# Altium schematic sheet SWITCH_CTRL1.SchDoc
size A4; SheetNumber: 4; SheetTotal: 16
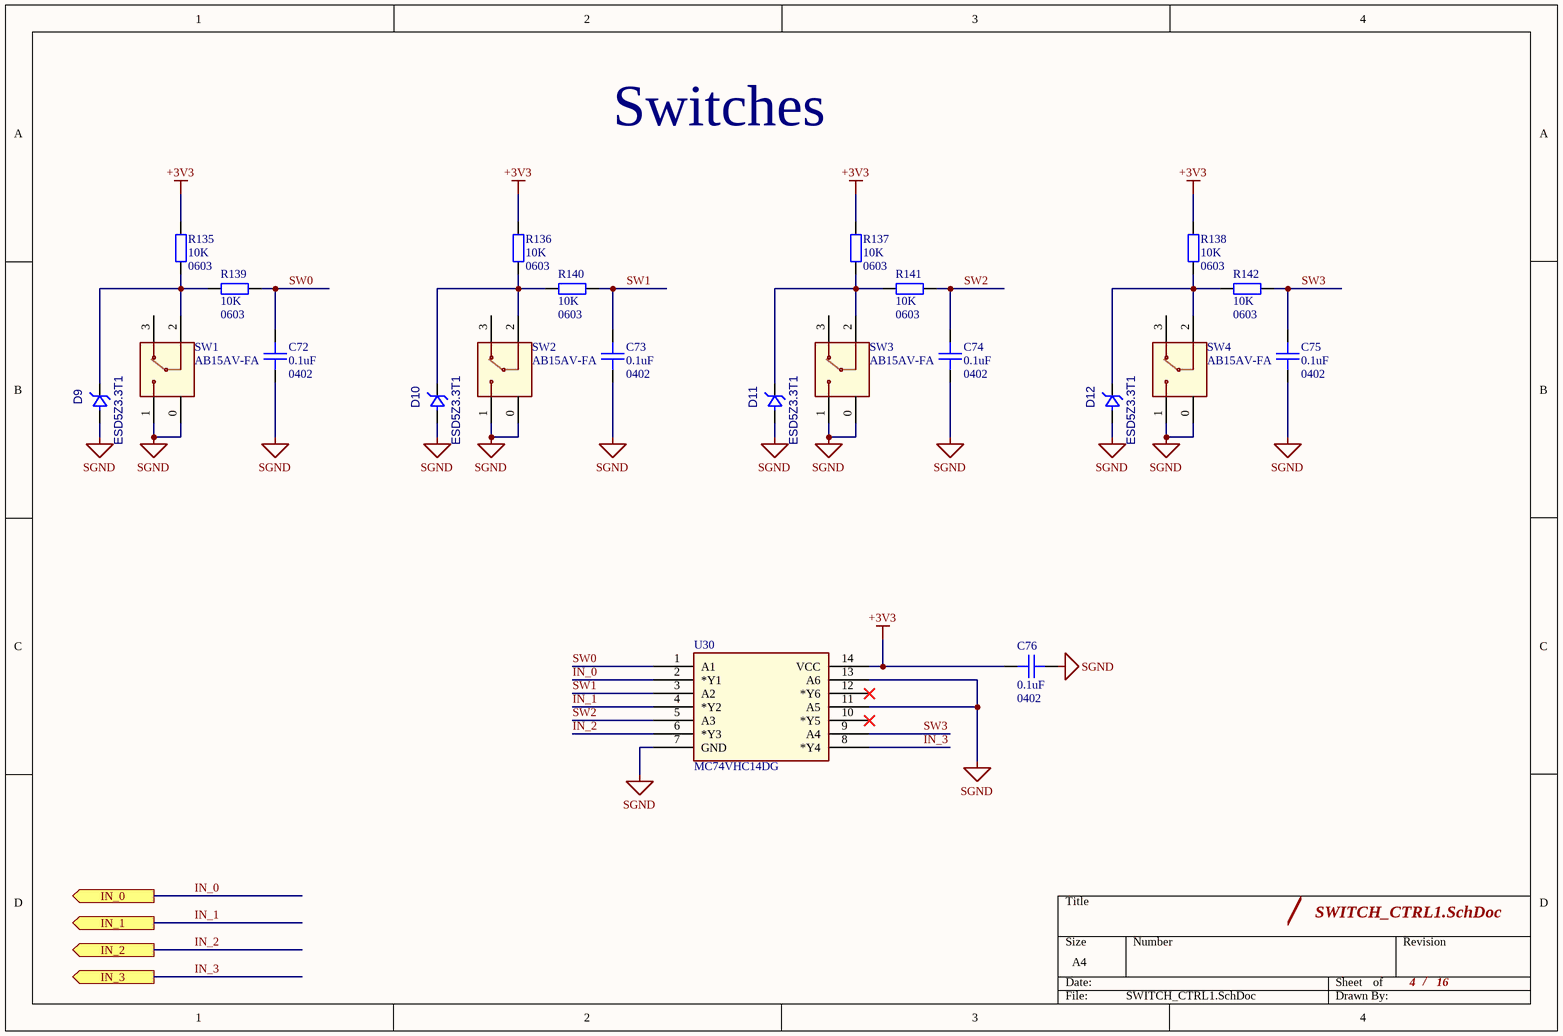
[diagram p0: SWITCH_CTRL1.SchDoc]

## Parts
C72  Capacitance: 0.1uF  Package1: 0402  [CAPC100x50x50L25]  (hidden comment: 04023C104KAT2A)
C73  Capacitance: 0.1uF  Package1: 0402  [CAPC100x50x50L25]  (hidden comment: 04023C104KAT2A)
C74  Capacitance: 0.1uF  Package1: 0402  [CAPC100x50x50L25]  (hidden comment: 04023C104KAT2A)
C75  Capacitance: 0.1uF  Package1: 0402  [CAPC100x50x50L25]  (hidden comment: 04023C104KAT2A)
C76  Capacitance: 0.1uF  Package1: 0402  [CAPC100x50x50L25]  (hidden comment: 04023C104KAT2A)
D9  ESD5Z3.3T1  [SOD-523]
D10  ESD5Z3.3T1  [SOD-523]
D11  ESD5Z3.3T1  [SOD-523]
D12  ESD5Z3.3T1  [SOD-523]
R135  Resistance: 10K  Size2: 0603  [RESC160X80X55L30]  (hidden comment: RC0603FR-0710KL)
R136  Resistance: 10K  Size2: 0603  [RESC160X80X55L30]  (hidden comment: RC0603FR-0710KL)
R137  Resistance: 10K  Size2: 0603  [RESC160X80X55L30]  (hidden comment: RC0603FR-0710KL)
R138  Resistance: 10K  Size2: 0603  [RESC160X80X55L30]  (hidden comment: RC0603FR-0710KL)
R139  Resistance: 10K  Size2: 0603  [RESC160X80X55L30]  (hidden comment: RC0603FR-0710KL)
R140  Resistance: 10K  Size2: 0603  [RESC160X80X55L30]  (hidden comment: RC0603FR-0710KL)
R141  Resistance: 10K  Size2: 0603  [RESC160X80X55L30]  (hidden comment: RC0603FR-0710KL)
R142  Resistance: 10K  Size2: 0603  [RESC160X80X55L30]  (hidden comment: RC0603FR-0710KL)
SW1  AB15AV-FA  [AB15AV-FA]
SW2  AB15AV-FA  [AB15AV-FA]
SW3  AB15AV-FA  [AB15AV-FA]
SW4  AB15AV-FA  [AB15AV-FA]
U30  MC74VHC14DG  [SOIC14P127_865X600X175L83X41]

## Ports
IN_0 (out), IN_1 (out), IN_2 (out), IN_3 (out)

## Nets
+3V3: C76.2 R135.2 R136.2 R137.2 R138.2 U30.14(VCC)
SGND: C72.1 C73.1 C74.1 C75.1 C76.1 D9.2(A) D10.2(A) D11.2(A) D12.2(A) SW1.0(SH) SW1.1 SW2.0(SH) SW2.1 SW3.0(SH) SW3.1 SW4.0(SH) SW4.1 U30.7(GND) U30.11(A5) U30.13(A6)
IN_0: U30.2(*Y1) ; port IN_0
IN_1: U30.4(*Y2) ; port IN_1
IN_2: U30.6(*Y3) ; port IN_2
IN_3: U30.8(*Y4) ; port IN_3
SW0: C72.2 R139.2 U30.1(A1)
SW1: C73.2 R140.2 U30.3(A2)
SW2: C74.2 R141.2 U30.5(A3)
SW3: C75.2 R142.2 U30.9(A4)
NetD9_1: D9.1(K) R135.1 R139.1 SW1.2
NetD10_1: D10.1(K) R136.1 R140.1 SW2.2
NetD11_1: D11.1(K) R137.1 R141.1 SW3.2
NetD12_1: D12.1(K) R138.1 R142.1 SW4.2

Not connected (* = marked no-connect by the designer): SW1 3; SW2 3; SW3 3; SW4 3; U30 10(*Y5)* 12(*Y6)*

## Notes on the sheet
- Switches
- /

## Library data of the parts
C72-C76 = CMP-001-0374-4: 0402 25V X7R 100 NF 10%; Manufacturer: KYOCERA AVX; Op Temp max: 85°C; Op Temp min: -55°C; ComponentLink3URL: https://www.digikey.com/en/products/detail/yageo/CC0402MRX5R5BB106/5195138; MPN: 04023C104KAT2A; ComponentLink1URL: https://www.yageo.com/upload/media/product/productsearch/datasheet/mlcc/UPY-GPHC_X5R_4V-to-50V_26.pdf; Package: 0402 (1005 Metric); Size: 1.00mm x 0.50mm; Height max: 700µm; Mounting Type: SM; Tolerance: 10%; ComponentLink1Description: Datasheet; ComponentLink3Description: Digikey; Ratings: -; Dielectric: X7R; ComponentLink2Description: Mouser; ComponentLink2URL: https://eu.mouser.com/ProductDetail/YAGEO/CC0402MRX5R5BB106?qs=zEY9bCHj09eCmUJdZuS5Lg%3D%3D; Lead Spacing: 0mm; Component Type: Ceramic Capacitor; Voltage Rating: 25V
D9-D12 = ESD5Z3.3T1: TVS DIODE 3.3VWM 14.1VC SOD523; MPN: ESD5Z3.3T1G/T5G; Type: Zener; Voltage - Reverse Standoff (Typ): 3.3V (Max); Voltage - Breakdown (Min): 5V; Voltage - Clamping (Max) @ Ipp: 14.1V; Capacitance @ Frequency: 105pF @ 1MHz; Temperature MIN: -55°C; Temperature MAX: 150°C; Package: SC-79, SOD-523; ComponentLink1Description: Datasheet; ComponentLink1URL: https://www.onsemi.com/pdf/datasheet/esd5z2.5t1-d.pdf; ComponentLink2Description: DigiKey; ComponentLink2URL: https://www.digikey.com/en/products/detail/onsemi/esd5z3-3t1/1476606
R135-R142 = CMP-001-0628-7: RES 10K OHM 1% 1/10W 0603; Manufacturer: YAGEO; Power: 100mW; Temperature Coefficient: ±100ppm; Op Temp max: 155°C; Op Temp min: -55°C; PMNT: DNP; Ratings: -; ComponentLink3URL: https://www.digikey.com/en/products/detail/yageo/RC0603FR-0710KL/726880?s=N4IgTCBcDaIEoGEAMA2JBmAYnAtEg7AIxIDSAMiALoC%2BQA; Size: 1.60mm x 0.80mm; ComponentLink1Description: Datasheet; ComponentLink3Description: Digikey; ComponentLink2Description: Mouser; ComponentLink1URL: https://www.yageo.com/upload/media/product/products/datasheet/rchip/PYu-RC_51_RoHS_P_4.pdf; Composition: Thick Film; Package: 0603 (1608 Metric); ComponentLink2URL: https://eu.mouser.com/ProductDetail/YAGEO/RC0603FR-0710KL?qs=grNVn54RoB%252B3GtjbJj3wJQ%3D%3D; Mounting Type: SM; Tolerance: 1%; Height max: 550µm; MPN: RC0603FR-0710KL; Component Type: Chip Resistor
SW1-SW4 = AB15AV-FA: SWITCH PUSH SPDT 0.4VA 28V; Mfr_Name: NKK Switches; MPN: AB15AV-FA; Type: SPDT; Voltage: 28V; ComponentLink1Description: Datasheet; ComponentLink1URL: https://www.nkkswitches.com/pdf/Apushbuttons.pdf; ComponentLink2Description: DigiKey; ComponentLink2URL: https://www.digikey.ee/en/products/detail/nkk-switches/AB15AV-FA/1055811
U30 = MC74VHC14DG: IC INVERT SCHMITT 6CH 1IN 14SOIC; Mfr_Name: onsemi; Supply Voltage min: 2V; Supply Voltage max: 5.5V; Logic Type: Inverter; MPN: MC74VHC14DG; ComponentLink1Description: DigiKey; ComponentLink1URL: https://www.digikey.at/en/products/detail/onsemi/MC74VHC14DG/1480797?s=N4IgTCBcDaILIGEDsAWAagCQQRhQEQHEQBdAXyA; ComponentLink2Description: New link; ComponentLink2URL: https://www.onsemi.com/pdf/datasheet/mc74vhc14-d.pdf